# EAGLE design LNA (EAGLE 9.6.2)
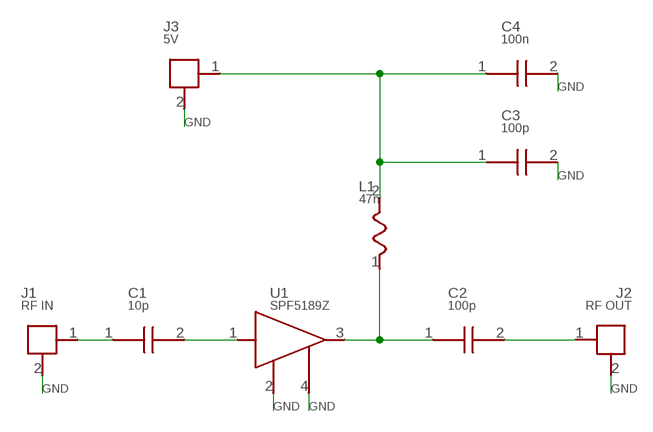
[diagram p0: schematic, sheet 1]

## Parts
C1  10p  CAP  [CAP]
C2  100p  CAP  [CAP]
C3  100p  CAP  [CAP]
C4  100n  CAP  [CAP]
J1  RF IN  COAX  [COAX]
J2  RF OUT  COAX  [COAX]
J3  5V  POWER  [POWER]
L1  47n  CHOKE  [CHOKE]
U1  SPF5189Z  MMIC  [MMIC]

## Nets
AMP_IN: C1.2 U1.1
BIAS_RF: C2.1 L1.1 U1.3
GND: C3.2 C4.2 J1.2 J2.2 J3.2 U1.2 U1.4
IN: C1.1 J1.1
OUT: C2.2 J2.1
VCC: C3.1 C4.1 J3.1 L1.2

## Library data of the parts
C1-C4 = RT:CAP
J1 J2 = RT:COAX
J3 = RT:POWER
L1 = RT:CHOKE
U1 = RT:MMIC

## Board
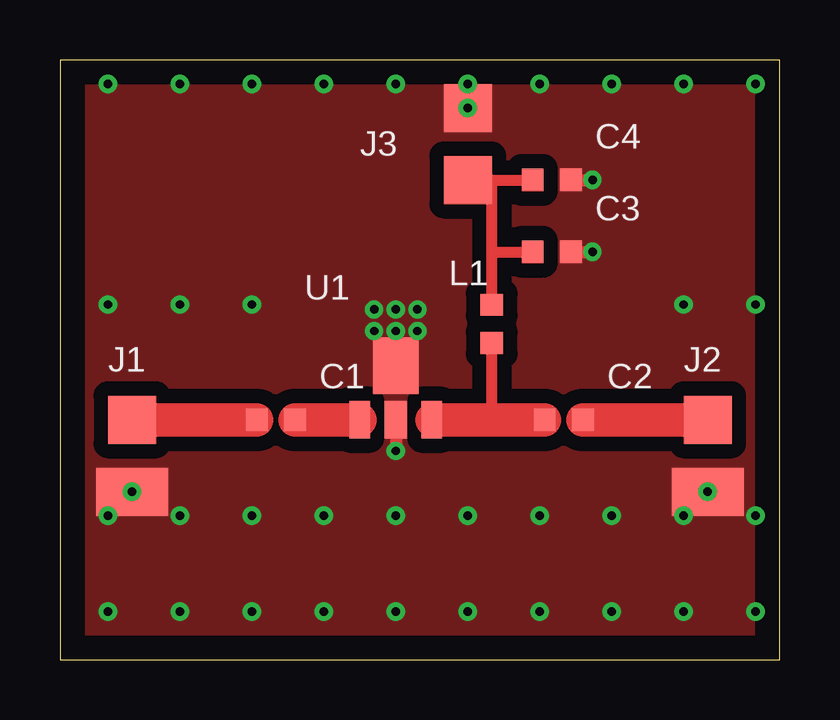
[diagram p1: board, top side]
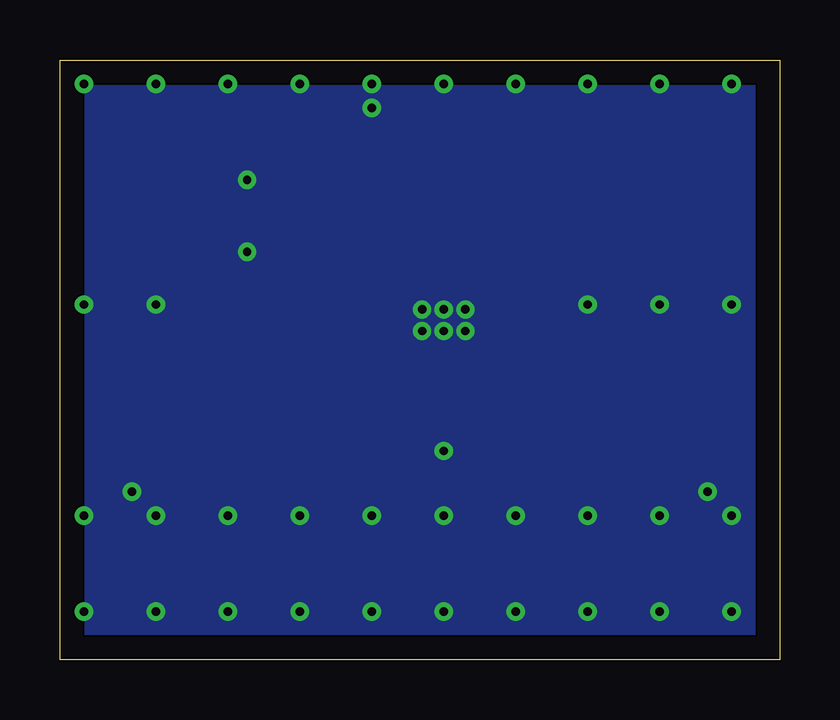
[diagram p2: board, bottom side, seen from below]

Size 30 x 25 mm. Coordinates in mm from the lower left corner, seen from the top.
Outline: 0,0 30,0 30,25 0,25 0,0
Copper layers (1*16): Top / dielectric 0.71mm / Bottom

### Footprints (pad centres in the part's own frame; a part is rotated, then mirrored left to right if it is on the bottom)
CAP = smd 0.9 x 0.95: 1 -0.8,0; 2 0.8,0
COAX = smd 2 x 2: 1 0,0 | smd 3 x 2: 2 0,-3
POWER = smd 2 x 2: 1 0,0; 2 0,3
CHOKE = smd 0.95 x 0.9: 1 0,-0.8; 2 0,0.8
MMIC = smd 0.85 x 1.55: 1 -1.5,-1.6; 3 1.5,-1.6 | smd 0.95 x 1.55: 2 0,-1.6 | smd 1.9 x 2.35: 4 0,0.65

### Placement (x,y rotation side)
C1  9,10 0 top
C2  21,10 0 top
C3  20.5,17 0 top
C4  20.5,20 0 top
J1  3,10 0 top
J2  27,10 0 top
J3  17,20 0 top
L1  18,14 0 top
U1  14,11.6 0 top

### Tracks (layer width: path | path; a pad name or v marks a point on that pad's centre or on a via)
AMP_IN
  Top 1.4: C1.2 U1.1
BIAS_RF
  Top 0.45: 18,10 L1.1
  Top 1.4: U1.3 18,10 C2.1
GND  (via drill 0.35 pad 0.75)
  Top 0.5: U1.2 v14,8.7 | U1.4 v14,13.7 | C3.2 v22.2,17 | C4.2 v22.2,20
  other vias: 13.1,13.7 14.9,13.7 13.1,14.6 14,14.6 14.9,14.6 17,23 3,7 27,7 2,2 2,6 2,14.8 2,24 5,2 5,6 5,14.8 5,24 8,2 8,6 8,14.8 8,24 11,2 11,6 11,24 14,2 14,6 14,24 17,2 17,6 17,24 20,2 20,6 20,24 23,2 23,6 23,24 26,2 26,6 26,14.8 26,24 29,2 29,6 29,14.8 29,24
  pour Top (isolate 0.6, no thermals): 0.35,0.35 29.65,0.35 29.65,24.65 0.35,24.65
  pour Bottom (isolate 0.6, no thermals): 0.35,0.35 29.65,0.35 29.65,24.65 0.35,24.65
IN
  Top 1.4: J1.1 C1.1
OUT
  Top 1.4: C2.2 J2.1
VCC
  Top 0.45: L1.2 18,17 | 18,17 C3.1 | 18,17 18,20 | 18,20 C4.1 | J3.1 18,20